# Altium schematic sheet Sensor_Section.SchDoc
size A4; DocumentNumber: 7; SheetNumber: 7; SheetTotal: 8
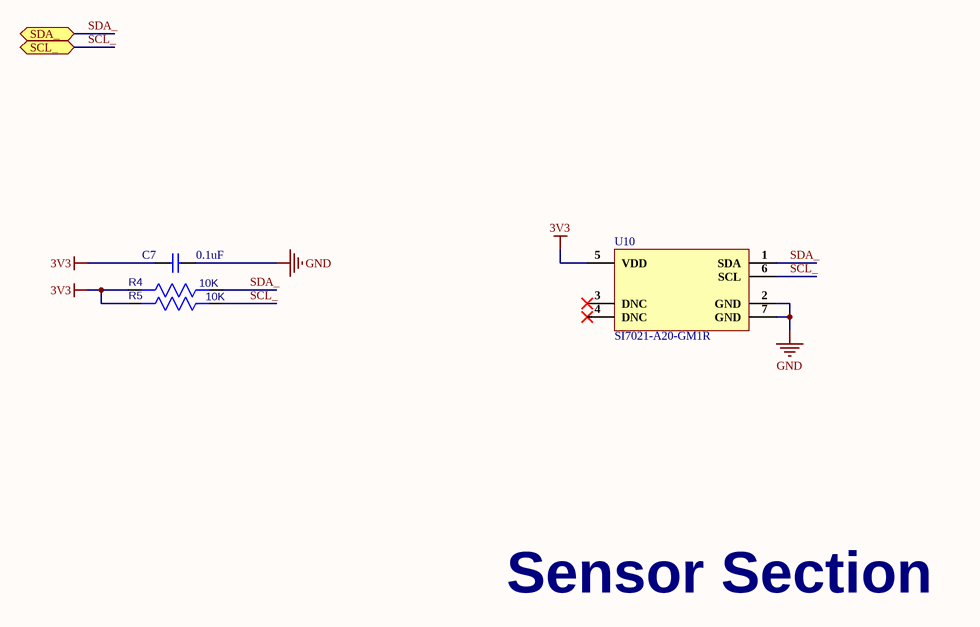
[diagram p0: Sensor_Section.SchDoc]

## Parts
C7  0.1uF  [Cap0805]
R4  10K  [RES0805]
R5  10K  [RES0805]
U10  SI7021-A20-GM1R  [SI7021-A20-GM1R]

## Ports
SCL_ (bidir), SDA_ (bidir)

## Nets
3V3: C7.1 R4.2 R5.2 U10.5(VDD)
GND: C7.2 U10.2(GND) U10.7(GND)
SCL_: R5.1 U10.6(SCL) ; port SCL_
SDA_: R4.1 U10.1(SDA) ; port SDA_

Not connected (* = marked no-connect by the designer): U10 3(DNC)* 4(DNC)*

## Notes on the sheet
- Sensor Section

## Library data of the parts
C7 = CL21F104ZBCNNNC: CAP CER 0.1UF 50V Y5V 0805; Manufacturer: Samsung; Material: Ceramic; Capacitance: 100nF; Tolerance: 80%; Supplier 1: Digi-Key; Manufacturer Part Number: CL21F104ZBCNNNC; Stock 1: 4901061; Pricing 1: 1=0.1, 10=0.044, 100=0.0195, 500=0.0139, 1000=0.01092 (USD); Mount: Surface Mount; Case/Package: 0805; Case Code (Metric): 2012; Case Code (Imperial): 0805; Min Operating Temperature: -30°C; Max Operating Temperature: 85°C; Dielectric: Y5V; Packaging: Tape and Reel; Voltage Rating: 50V; Package Quantity: 1; Length: 2mm; Height: 0.85mm; Width: 0.049inch; Thickness: 0.037inch; Depth: 1.25mm; Radiation Hardening: No; ComponentLink1URL: https://media.digikey.com/pdf/Data%20Sheets/Samsung%20PDFs/CL_Series_MLCC_ds.pdf?src-supplier=Digi-Key; ComponentLink1Description: https://media.digikey.com/pdf/Data%20Sheets/Samsung%20PDFs/CL_Series_MLCC_ds.pdf?src-supplier=Digi-Key; Supplier Part Number 1: 1276-1007-6-ND
R4 R5 = ERJ-P06J103V: RES SMD 10K OHM 5% 1/2W 0805; Manufacturer: Panasonic; Resistance: 10kR; Power Rating: 500mW; Voltage Rating: 400V; Temperature Coefficient: 200ppm/°C; Voltage Rating (DC): 150V; ComponentLink1URL: https://www.verical.com/server-webapp/html/getDatasheet?partID=409513; ComponentLink1Description: https://www.verical.com/server-webapp/html/getDatasheet?partID=409513; ComponentLink2URL: http://components.arrow.com/part/dataview/44988207S7163511N1174; ComponentLink2Description: http://components.arrow.com/part/dataview/44988207S7163511N1174; ComponentLink3URL: https://www.seielect.com/Catalog/SEI-RMCF_RMCP.pdf; ComponentLink3Description: https://www.seielect.com/Catalog/SEI-RMCF_RMCP.pdf; ComponentLink4URL: http://www.seielect.com/catalog/sei-rmc.pdf; ComponentLink4Description: http://www.seielect.com/catalog/sei-rmc.pdf; ComponentLink5URL: https://datasheet.ciiva.com/7777/424479-7777391.pdf; ComponentLink5Description: https://datasheet.ciiva.com/7777/424479-7777391.pdf; ComponentLink6URL: https://datasheet.ciiva.com/2581/crcwhpe3-2581488.pdf; ComponentLink6Description: https://datasheet.ciiva.com/2581/crcwhpe3-2581488.pdf; ComponentLink7URL: https://datasheet.ciiva.com/11808/0900766b80d98b26-11808546.pdf; ComponentLink7Description: https://datasheet.ciiva.com/11808/0900766b80d98b26-11808546.pdf; ComponentLink8URL: https://datasheet.ciiva.com/8934/dcrcwe3-8934585.pdf; ComponentLink8Description: https://datasheet.ciiva.com/8934/dcrcwe3-8934585.pdf; ComponentLink9URL: https://datasheet.ciiva.com/2467/dcrcwe3-2467241.pdf; ComponentLink9Description: https://datasheet.ciiva.com/2467/dcrcwe3-2467241.pdf; ComponentLink10URL: https://datasheet.ciiva.com/7777/1697337-7777401.pdf; ComponentLink10Description: https://datasheet.ciiva.com/7777/1697337-7777401.pdf; ComponentLink11URL: https://datasheet.ciiva.com/16852/dcrcwe3-16852347.pdf; ComponentLink11Description: https://datasheet.ciiva.com/16852/dcrcwe3-16852347.pdf; ComponentLink12URL: https://datasheet.ciiva.com/16200/dcrcwe3-16200123.pdf; ComponentLink12Description: https://datasheet.ciiva.com/16200/dcrcwe3-16200123.pdf; ComponentLink13URL: https://datasheet.ciiva.com/16725/70201119-16725227.pdf; ComponentLink13Description: https://datasheet.ciiva.com/16725/70201119-16725227.pdf; ComponentLink14URL: https://datasheet.ciiva.com/2467/dcrcwe3-2467239.pdf; ComponentLink14Description: https://datasheet.ciiva.com/2467/dcrcwe3-2467239.pdf; ComponentLink15URL: https://datasheet.ciiva.com/7777/1720486-7777575.pdf; ComponentLink15Description: https://datasheet.ciiva.com/7777/1720486-7777575.pdf; ComponentLink16URL: https://datasheet.ciiva.com/8934/dcrcwe3-8934581.pdf; ComponentLink16Description: https://datasheet.ciiva.com/8934/dcrcwe3-8934581.pdf; ComponentLink17URL: https://datasheet.ciiva.com/2467/dcrcwe3-2467240.pdf; ComponentLink17Description: https://datasheet.ciiva.com/2467/dcrcwe3-2467240.pdf; ComponentLink18URL: https://datasheet.ciiva.com/7777/1720486-7777576.pdf; ComponentLink18Description: https://datasheet.ciiva.com/7777/1720486-7777576.pdf; ComponentLink19URL: https://datasheet.ciiva.com/5546/dcrcwe3-109170-5546983.pdf; ComponentLink19Description: https://datasheet.ciiva.com/5546/dcrcwe3-109170-5546983.pdf; ComponentLink20URL: https://datasheet.ciiva.com/16755/70201119-16755757.pdf; ComponentLink20Description: https://datasheet.ciiva.com/16755/70201119-16755757.pdf; ComponentLink21URL: https://datasheet.ciiva.com/3258/dcrcwe3-3258221.pdf; ComponentLink21Description: https://datasheet.ciiva.com/3258/dcrcwe3-3258221.pdf; ComponentLink22URL: https://datasheet.ciiva.com/17204/dcrcwe3-17204398.pdf; ComponentLink22Description: https://datasheet.ciiva.com/17204/dcrcwe3-17204398.pdf; ComponentLink23URL: https://datasheet.ciiva.com/16435/dcrcwe3-16435934.pdf; ComponentLink23Description: https://datasheet.ciiva.com/16435/dcrcwe3-16435934.pdf; ComponentLink24URL: https://datasheet.ciiva.com/46441/1533075-46441628.pdf; ComponentLink24Description: https://datasheet.ciiva.com/46441/1533075-46441628.pdf; ComponentLink25URL: https://datasheet.ciiva.com/5544/dcrcwe3-109170-5544649.pdf; ComponentLink25Description: https://datasheet.ciiva.com/5544/dcrcwe3-109170-5544649.pdf; ComponentLink26URL: https://datasheet.ciiva.com/8337/dcrcwe3-8337669.pdf; ComponentLink26Description: https://datasheet.ciiva.com/8337/dcrcwe3-8337669.pdf; ComponentLink27URL: https://datasheet.ciiva.com/2463/dcrcwe3-2463179.pdf; ComponentLink27Description: https://datasheet.ciiva.com/2463/dcrcwe3-2463179.pdf; ComponentLink28URL: https://datasheet.ciiva.com/2463/dcrcwe3-2463178.pdf; ComponentLink28Description: https://datasheet.ciiva.com/2463/dcrcwe3-2463178.pdf; ComponentLink29URL: https://datasheet.ciiva.com/2474/crcwhpe3-2474640.pdf; ComponentLink29Description: https://datasheet.ciiva.com/2474/crcwhpe3-2474640.pdf; ComponentLink30URL: https://datasheet.ciiva.com/48527/crcwhpe3-48527638.pdf; ComponentLink30Description: https://datasheet.ciiva.com/48527/crcwhpe3-48527638.pdf; ComponentLink31URL: https://datasheet.ciiva.com/5547/crcwhpe3-46056-5547896.pdf; ComponentLink31Description: https://datasheet.ciiva.com/5547/crcwhpe3-46056-5547896.pdf; ComponentLink32URL: https://datasheet.ciiva.com/9112/crcwhpe3-9112140.pdf; ComponentLink32Description: https://datasheet.ciiva.com/9112/crcwhpe3-9112140.pdf; ComponentLink33URL: https://datasheet.ciiva.com/2474/crcwhpe3-2474638.pdf; ComponentLink33Description: https://datasheet.ciiva.com/2474/crcwhpe3-2474638.pdf; ComponentLink34URL: https://datasheet.ciiva.com/2474/crcwhpe3-2474639.pdf; ComponentLink34Description: https://datasheet.ciiva.com/2474/crcwhpe3-2474639.pdf; Supplier 1: Digi-Key; Manufacturer Part Number: ERJ-P06J103V; Stock 1: 130484; Pricing 1: 1=0.11, 10=0.103, 100=0.0396, 1000=0.0174, 2500=0.0151 (USD); Mount: Surface Mount; Case/Package: 0805; Weight: 0.000194oz; Case Code (Metric): 2012; Case Code (Imperial): 0805; Contact Plating: Tin; Min Operating Temperature: -55°C; Max Operating Temperature: 155°C; Tolerance: 5%; Packaging: Tape and Reel; Package Quantity: 1; Composition: Thick Film; Number of Terminations: 2; Termination: SMD/SMT; Military Standard: Not; Max Power Dissipation: 500mW; Features: Automotive AEC-Q200; Length: 2mm; Height: 0.6mm; Width: 0.049inch; Depth: 1.25mm; Radiation Hardening: No; REACH SVHC: Unknown; Lead Free: Lead Free; ComponentLink35URL: http://uk.rs-online.com/webdocs/12cb/0900766b812cb812.pdf?src-supplier=RSComponents; ComponentLink35Description: http://uk.rs-online.com/webdocs/12cb/0900766b812cb812.pdf?src-supplier=RSComponents; ComponentLink36URL: http://industrial.panasonic.com/www-data/pdf/AOA0000/AOA0000CE4.pdf?src-supplier=Avnet; ComponentLink36Description: http://industrial.panasonic.com/www-data/pdf/AOA0000/AOA0000CE4.pdf?src-supplier=Avnet; ComponentLink37URL: http://industrial.panasonic.com/www-data/pdf/AOA0000/AOA0000CE4.pdf?src-supplier=Future+Electronics; ComponentLink37Description: http://industrial.panasonic.com/www-data/pdf/AOA0000/AOA0000CE4.pdf?src-supplier=Future+Electronics; ComponentLink38URL: http://www.farnell.com/datasheets/2059624.pdf?src-supplier=Element14; ComponentLink38Description: http://www.farnell.com/datasheets/2059624.pdf?src-supplier=Element14; ComponentLink39URL: https://www.alliedelec.com/m/d/12e4be79354a6c30aae91f11e8182ea0.pdf?src-supplier=Allied+Electronics; ComponentLink39Description: https://www.alliedelec.com/m/d/12e4be79354a6c30aae91f11e8182ea0.pdf?src-supplier=Allied+Electronics; ComponentLink40URL: http://www.farnell.com/datasheets/2059624.pdf?src-supplier=Farnell; ComponentLink40Description: http://www.farnell.com/datasheets/2059624.pdf?src-supplier=Farnell; Supplier Part Number 1: P10KADCT-ND
U10 = SI7021-A20-GM1R: SENS HUMID/TEMP 3.6V I2C 2% 6DFN; Manufacturer: Silicon Labs; Response Time: 18s; Accuracy: 3%; Sensor Type: Temperature; Output Type: I2C,Digital; Supplier 1: Digi-Key; Manufacturer Part Number: SI7021-A20-GM1R; Stock 1: 8770; Pricing 1: 1=3.37, 25=3.2436, 100=3.2313 (USD); Mount: Surface Mount; Min Operating Temperature: -40°C; Max Operating Temperature: 85°C; ComponentLink1URL: https://www.silabs.com/Support%20Documents/TechnicalDocs/Si7021-A20.pdf?src-supplier=Avnet; ComponentLink1Description: https://www.silabs.com/Support%20Documents/TechnicalDocs/Si7021-A20.pdf?src-supplier=Avnet; ComponentLink2URL: https://www.silabs.com/documents/public/data-sheets/Si7021-A20.pdf?src-supplier=Newark; ComponentLink2Description: https://www.silabs.com/documents/public/data-sheets/Si7021-A20.pdf?src-supplier=Newark; ComponentLink3URL: https://www.silabs.com/Support%20Documents%2fTechnicalDocs%2fSi7021-A20.pdf?src-supplier=Digi-Key; ComponentLink3Description: https://www.silabs.com/Support%20Documents%2fTechnicalDocs%2fSi7021-A20.pdf?src-supplier=Digi-Key; ComponentLink4URL: https://www.silabs.com/Support%20Documents/TechnicalDocs/Si7021-A20.pdf?src-supplier=Avnet+Asia; ComponentLink4Description: https://www.silabs.com/Support%20Documents/TechnicalDocs/Si7021-A20.pdf?src-supplier=Avnet+Asia; ComponentLink5URL: https://www.silabs.com/documents/public/data-sheets/Si7021-A20.pdf?src-supplier=Digi-Key; ComponentLink5Description: https://www.silabs.com/documents/public/data-sheets/Si7021-A20.pdf?src-supplier=Digi-Key; ComponentLink6URL: https://www.silabs.com/documents/public/data-sheets/Si7021-A20.pdf?src-supplier=Farnell; ComponentLink6Description: https://www.silabs.com/documents/public/data-sheets/Si7021-A20.pdf?src-supplier=Farnell; Supplier Part Number 1: 336-4380-1-ND